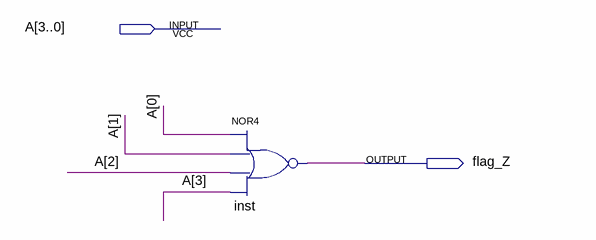
[diagram p0: schematic sheet]
// Quartus schematic flag_z.bdf as structural Verilog: 1 symbols, 2 pins
module flag_z (
  input  [3:0] A,
  output flag_Z
);

  nor inst (flag_Z, A[0], A[1], A[2], A[3]);
endmodule
